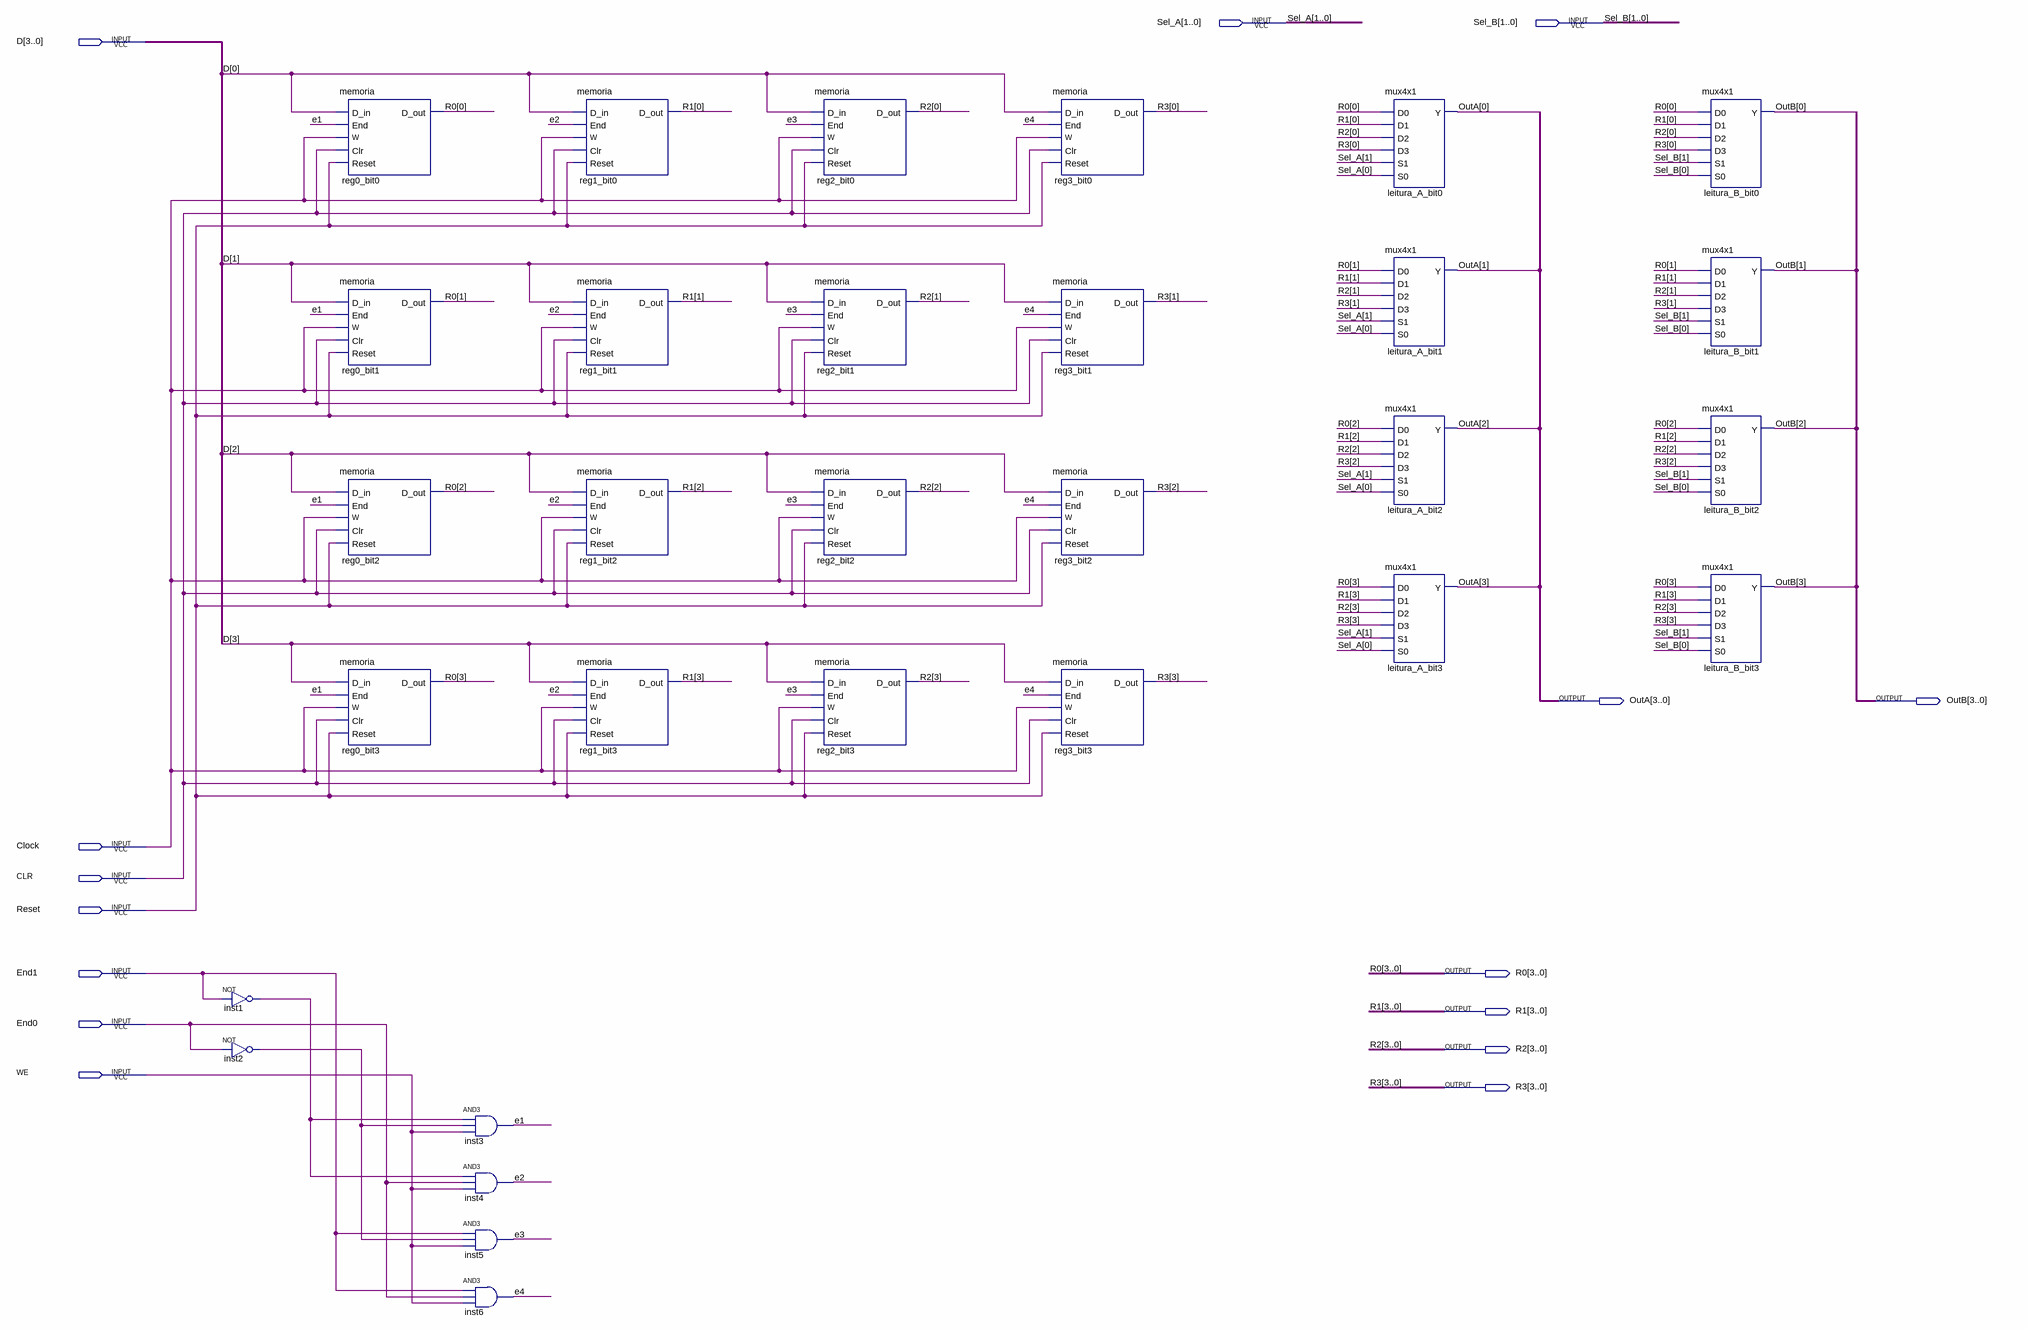
[diagram p0: schematic sheet]
// Quartus schematic memoria4x4.bdf as structural Verilog: 30 symbols, 15 pins
module memoria4x4 (
  input  [1:0] Sel_A,
  input  [1:0] Sel_B,
  input  [3:0] D,
  input  Clock,
  input  CLR,
  input  Reset,
  input  End1,
  input  End0,
  input  WE,
  output [3:0] OutA,
  output [3:0] OutB,
  output [3:0] R0,
  output [3:0] R1,
  output [3:0] R2,
  output [3:0] R3
);

  wire e1, e2, e3, e4, inst1_out, inst2_out;

  not inst1 (inst1_out, End1);
  not inst2 (inst2_out, End0);
  memoria reg0_bit0 (.D_in(D[0]), .End(e1), .W(Clock), .Clr(CLR), .Reset(Reset), .D_out(R0[0]));
  memoria reg0_bit1 (.D_in(D[1]), .End(e1), .W(Clock), .Clr(CLR), .Reset(Reset), .D_out(R0[1]));
  memoria reg0_bit2 (.D_in(D[2]), .End(e1), .W(Clock), .Clr(CLR), .Reset(Reset), .D_out(R0[2]));
  memoria reg0_bit3 (.D_in(D[3]), .End(e1), .W(Clock), .Clr(CLR), .Reset(Reset), .D_out(R0[3]));
  and inst3 (e1, inst1_out, inst2_out, WE);
  and inst4 (e2, inst1_out, End0, WE);
  and inst5 (e3, End1, inst2_out, WE);
  and inst6 (e4, End1, End0, WE);
  memoria reg1_bit0 (.D_in(D[0]), .End(e2), .W(Clock), .Clr(CLR), .Reset(Reset), .D_out(R1[0]));
  memoria reg1_bit1 (.D_in(D[1]), .End(e2), .W(Clock), .Clr(CLR), .Reset(Reset), .D_out(R1[1]));
  memoria reg1_bit2 (.D_in(D[2]), .End(e2), .W(Clock), .Clr(CLR), .Reset(Reset), .D_out(R1[2]));
  memoria reg1_bit3 (.D_in(D[3]), .End(e2), .W(Clock), .Clr(CLR), .Reset(Reset), .D_out(R1[3]));
  memoria reg2_bit0 (.D_in(D[0]), .End(e3), .W(Clock), .Clr(CLR), .Reset(Reset), .D_out(R2[0]));
  memoria reg2_bit1 (.D_in(D[1]), .End(e3), .W(Clock), .Clr(CLR), .Reset(Reset), .D_out(R2[1]));
  memoria reg2_bit2 (.D_in(D[2]), .End(e3), .W(Clock), .Clr(CLR), .Reset(Reset), .D_out(R2[2]));
  memoria reg2_bit3 (.D_in(D[3]), .End(e3), .W(Clock), .Clr(CLR), .Reset(Reset), .D_out(R2[3]));
  memoria reg3_bit0 (.D_in(D[0]), .End(e4), .W(Clock), .Clr(CLR), .Reset(Reset), .D_out(R3[0]));
  memoria reg3_bit1 (.D_in(D[1]), .End(e4), .W(Clock), .Clr(CLR), .Reset(Reset), .D_out(R3[1]));
  memoria reg3_bit2 (.D_in(D[2]), .End(e4), .W(Clock), .Clr(CLR), .Reset(Reset), .D_out(R3[2]));
  memoria reg3_bit3 (.D_in(D[3]), .End(e4), .W(Clock), .Clr(CLR), .Reset(Reset), .D_out(R3[3]));
  mux4x1 leitura_A_bit0 (.D0(R0[0]), .D1(R1[0]), .D2(R2[0]), .D3(R3[0]), .S1(Sel_A[1]), .S0(Sel_A[0]), .Y(OutA[0]));
  mux4x1 leitura_A_bit1 (.D0(R0[1]), .D1(R1[1]), .D2(R2[1]), .D3(R3[1]), .S1(Sel_A[1]), .S0(Sel_A[0]), .Y(OutA[1]));
  mux4x1 leitura_A_bit2 (.D0(R0[2]), .D1(R1[2]), .D2(R2[2]), .D3(R3[2]), .S1(Sel_A[1]), .S0(Sel_A[0]), .Y(OutA[2]));
  mux4x1 leitura_A_bit3 (.D0(R0[3]), .D1(R1[3]), .D2(R2[3]), .D3(R3[3]), .S1(Sel_A[1]), .S0(Sel_A[0]), .Y(OutA[3]));
  mux4x1 leitura_B_bit0 (.D0(R0[0]), .D1(R1[0]), .D2(R2[0]), .D3(R3[0]), .S1(Sel_B[1]), .S0(Sel_B[0]), .Y(OutB[0]));
  mux4x1 leitura_B_bit1 (.D0(R0[1]), .D1(R1[1]), .D2(R2[1]), .D3(R3[1]), .S1(Sel_B[1]), .S0(Sel_B[0]), .Y(OutB[1]));
  mux4x1 leitura_B_bit2 (.D0(R0[2]), .D1(R1[2]), .D2(R2[2]), .D3(R3[2]), .S1(Sel_B[1]), .S0(Sel_B[0]), .Y(OutB[2]));
  mux4x1 leitura_B_bit3 (.D0(R0[3]), .D1(R1[3]), .D2(R2[3]), .D3(R3[3]), .S1(Sel_B[1]), .S0(Sel_B[0]), .Y(OutB[3]));
endmodule
